# Altium schematic sheet Sheet1.SchDoc
size 454 x 279 mm; SheetNumber: 1; SheetTotal: 1
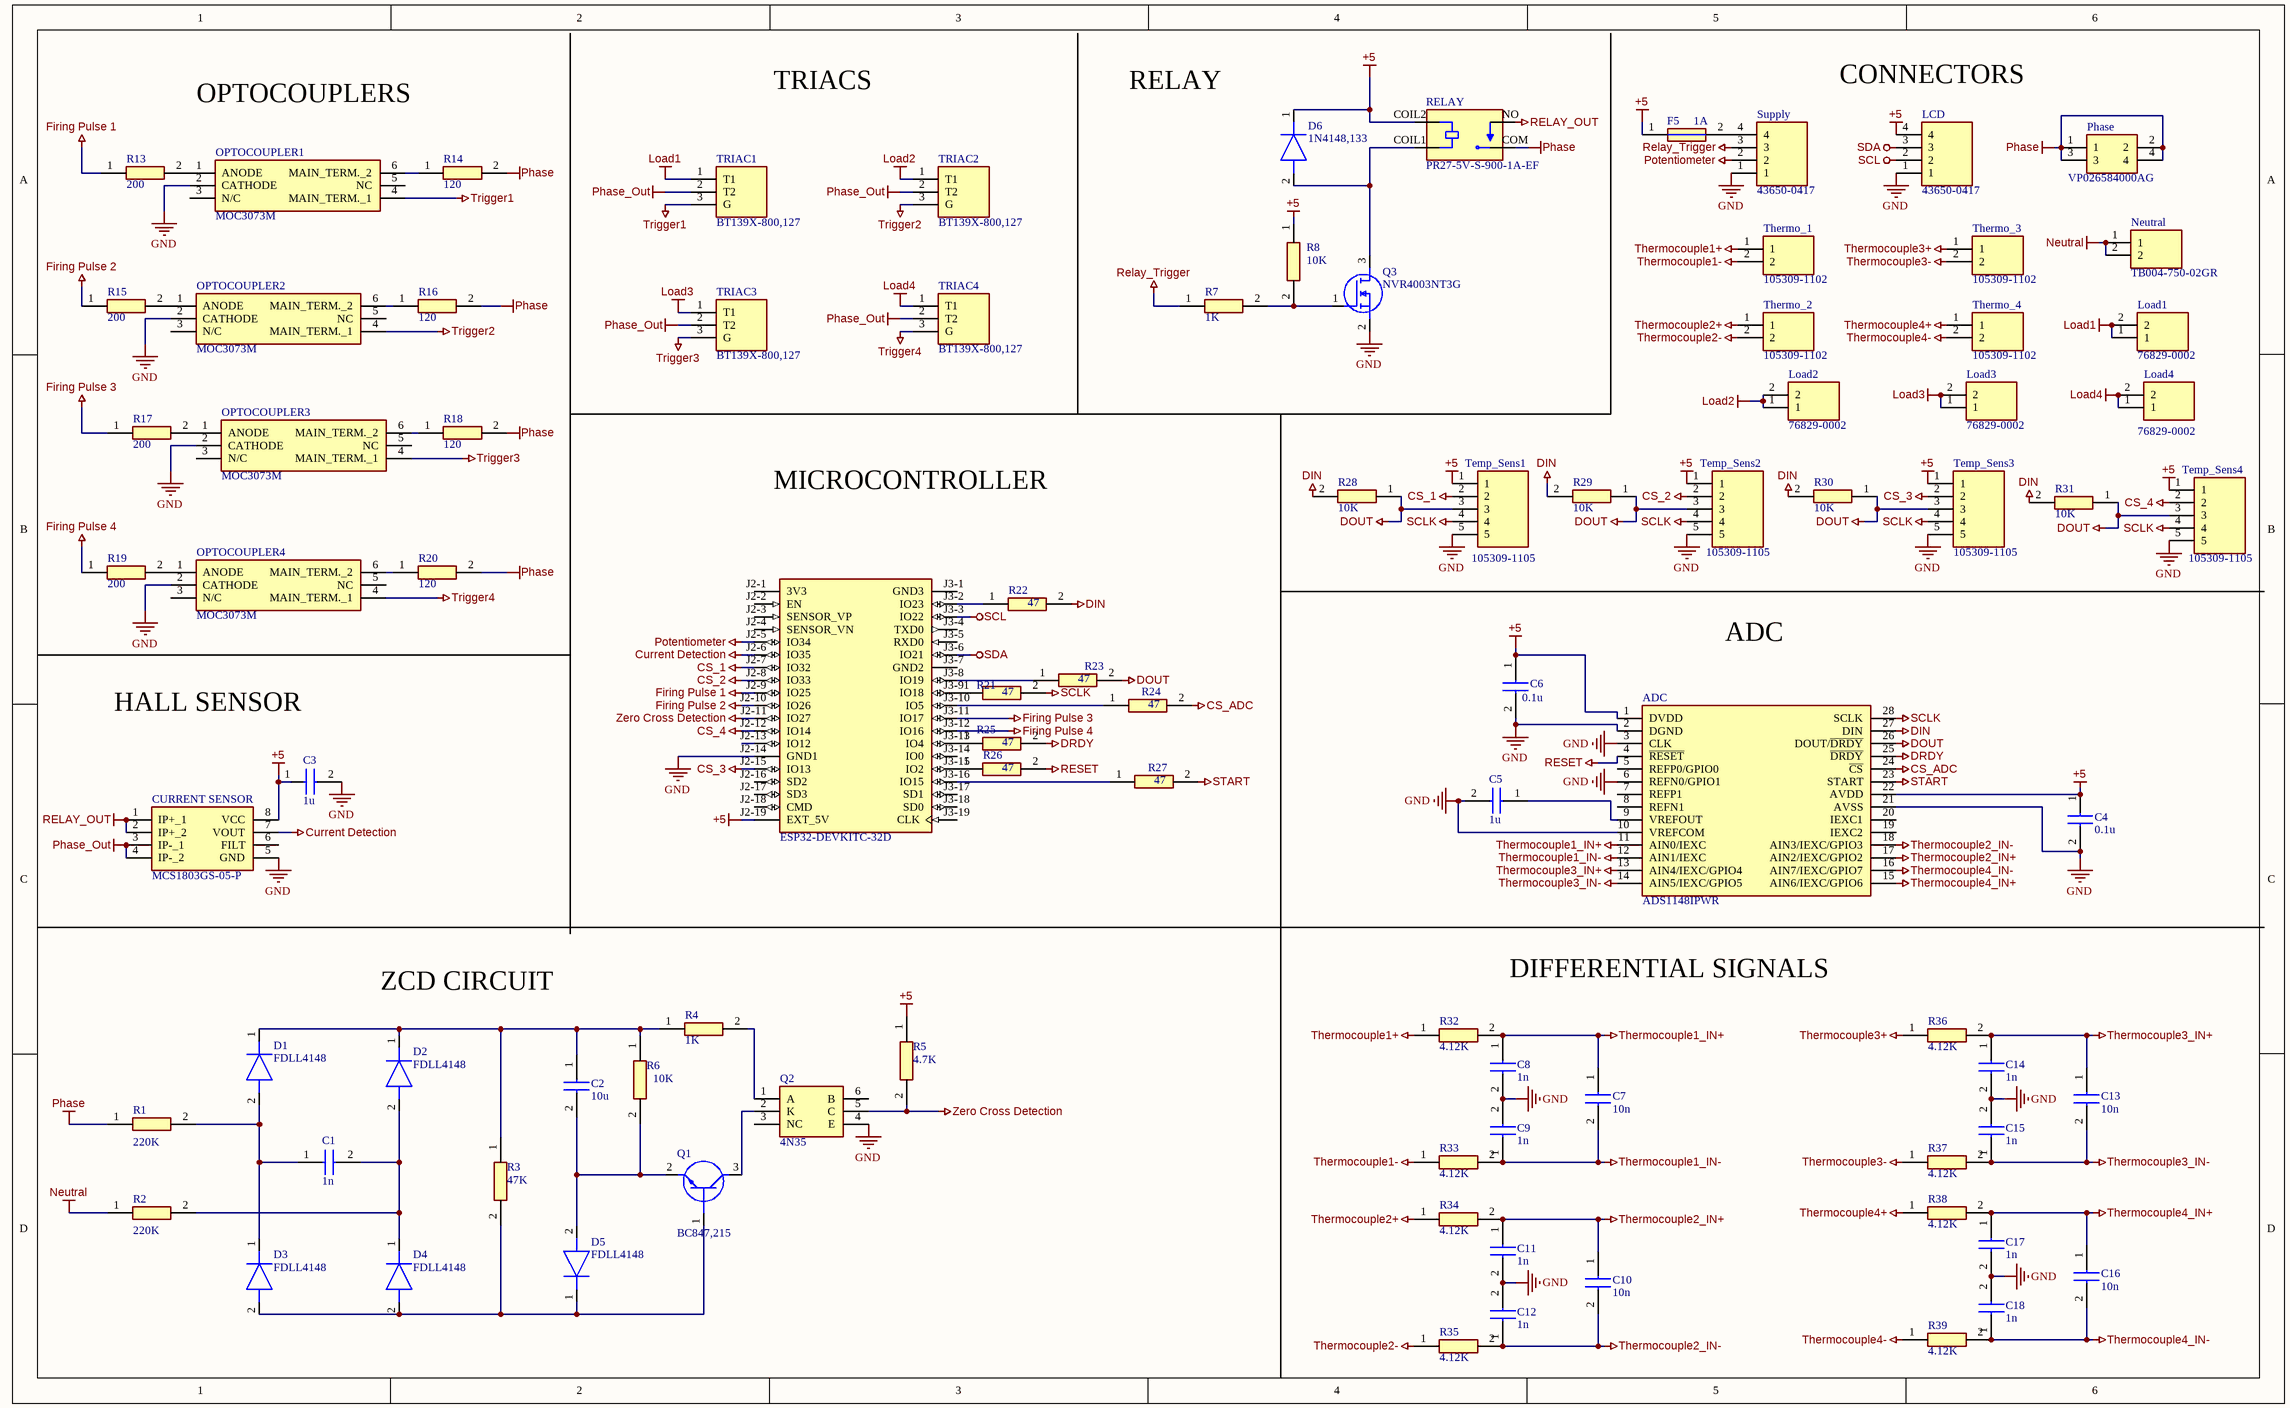
[diagram p0: Sheet1.SchDoc]

## Parts
?  ESP32-DEVKITC-32D  [MODULE_ESP32-DEVKITC-32D]
ADC  ADS1148IPWR  [SOP65P640X120-28N]
C1  1n  [CAPC1608X90N]
C2  10u  [CAPC1608X102N]
C3  1u  [CAPC1608X90N]
C4  0.1u  [CAPC1608X95N]
C5  1u  [CAPC1608X90N]
C6  0.1u  [CAPC1608X95N]
C7  10n  [CAPC1608X87N]
C8  1n  [CAPC1608X90N]
C9  1n  [CAPC1608X90N]
C10  10n  [CAPC1608X87N]
C11  1n  [CAPC1608X90N]
C12  1n  [CAPC1608X90N]
C13  10n  [CAPC1608X87N]
C14  1n  [CAPC1608X90N]
C15  1n  [CAPC1608X90N]
C16  10n  [CAPC1608X87N]
C17  1n  [CAPC1608X90N]
C18  1n  [CAPC1608X90N]
CURRENT_SENSOR  MCS1803GS-05-P  [SOIC127P600X175-8N]
D1  FDLL4148  [FDLL4448]
D2  FDLL4148  [FDLL4448]
D3  FDLL4148  [FDLL4448]
D4  FDLL4148  [FDLL4448]
D5  FDLL4148  [FDLL4448]
D6  1N4148,133  [DIOAD1165W56L425D185]
F5  1A  [FUSC2012X55N]
LCD  43650-0417  [43650-04YY_151617]
Load1  76829-0002  [768290002]
Load2  76829-0002  [768290002]
Load3  76829-0002  [768290002]
Load4  76829-0002  [768290002]
Neutral  TB004-750-02GR  [TB00475002GR]
OPTOCOUPLER1  MOC3073M  [DIP762W51P254L851H508Q6N]
OPTOCOUPLER2  MOC3073M  [DIP762W51P254L851H508Q6N]
OPTOCOUPLER3  MOC3073M  [DIP762W51P254L851H508Q6N]
OPTOCOUPLER4  MOC3073M  [DIP762W51P254L851H508Q6N]
Phase  VP026584000AG  [SHDR4W100P1016_2X2_2032X1830X2850P]
Q1  BC847,215  [BC847215]
Q2  4N35  [DIP762W50P254L712H450Q6N]
Q3  NVR4003NT3G  [SOT96P237X111-3N]
R1  220K  [RESC1608X55N]
R2  220K  [RESC1608X55N]
R3  47K  [RESC1608X55N]
R4  1K  [RESC1608X55N]
R5  4.7K  [RESC1608X55N]
R6  10K  [RESC1608X50N]
R7  1K  [RESC1608X55N]
R8  10K  [RESC1608X50N]
R13  200  [ERA3AEB101V]
R14  120  [RESC1608X50N]
R15  200  [ERA3AEB101V]
R16  120  [RESC1608X50N]
R17  200  [ERA3AEB101V]
R18  120  [RESC1608X50N]
R19  200  [ERA3AEB101V]
R20  120  [RESC1608X50N]
R21  47  [RESC1608X55N]
R22  47  [RESC1608X55N]
R23  47  [RESC1608X55N]
R24  47  [RESC1608X55N]
R25  47  [RESC1608X55N]
R26  47  [RESC1608X55N]
R27  47  [RESC1608X55N]
R28  10K  [RESC1608X50N]
R29  10K  [RESC1608X50N]
R30  10K  [RESC1608X50N]
R31  10K  [RESC1608X50N]
R32  4.12K  [ERJP03_PA3_(0603)]
R33  4.12K  [ERJP03_PA3_(0603)]
R34  4.12K  [ERJP03_PA3_(0603)]
R35  4.12K  [ERJP03_PA3_(0603)]
R36  4.12K  [ERJP03_PA3_(0603)]
R37  4.12K  [ERJP03_PA3_(0603)]
R38  4.12K  [ERJP03_PA3_(0603)]
R39  4.12K  [ERJP03_PA3_(0603)]
RELAY  PR27-5V-S-900-1A-EF  [RELAY_PR27-5V-S-900-1A-EF]
Supply  43650-0417  [43650-04YY_151617]
Temp_Sens1  105309-1105  [1053091105]
Temp_Sens2  105309-1105  [1053091105]
Temp_Sens3  105309-1105  [1053091105]
Temp_Sens4  105309-1105  [1053091105]
Thermo_1  105309-1102  [1053091102]
Thermo_2  105309-1102  [1053091102]
Thermo_3  105309-1102  [1053091102]
Thermo_4  105309-1102  [1053091102]
TRIAC1  BT139X-800,127  [TO254P460X1000X1910-3P]
TRIAC2  BT139X-800,127  [TO254P460X1000X1910-3P]
TRIAC3  BT139X-800,127  [TO254P460X1000X1910-3P]
TRIAC4  BT139X-800,127  [TO254P460X1000X1910-3P]

## Nets
+5: ?.J2-19(EXT_5V) ADC.1(DVDD) ADC.22(AVDD) C3.1 C4.1 C6.1 CURRENT_SENSOR.8(VCC) D6.1(K) F5.1 LCD.4 R5.1 R8.1 RELAY.COIL2 Temp_Sens1.1 Temp_Sens2.1 Temp_Sens3.1 Temp_Sens4.1
CS_1: ?.J2-7(IO32) Temp_Sens1.2
CS_2: ?.J2-8(IO33) Temp_Sens2.2
CS_3: ?.J2-15(IO13) Temp_Sens3.2
CS_4: ?.J2-12(IO14) Temp_Sens4.2
CS_ADC: ADC.24(~{CS}) R24.2
Current Detection: ?.J2-6(IO35) CURRENT_SENSOR.7(VOUT)
DIN: ADC.27(DIN) R22.2 R28.2 R29.2 R30.2 R31.2
DOUT: ADC.26(DOUT/~{DRDY}) R23.2 R28.1 R29.1 R30.1 R31.1 Temp_Sens1.3 Temp_Sens2.3 Temp_Sens3.3 Temp_Sens4.3
DRDY: ADC.25(~{DRDY}) R25.2
Firing Pulse 1: ?.J2-9(IO25) R13.1
Firing Pulse 2: ?.J2-10(IO26) R15.1
Firing Pulse 3: ?.J3-11(IO17) R17.1
Firing Pulse 4: ?.J3-12(IO16) R19.1
GND: ?.J2-14(GND1) ADC.2(DGND) ADC.3(CLK) ADC.6(REFN0/GPIO1) ADC.10(VREFCOM) ADC.21(AVSS) C3.2 C4.2 C5.2 C6.2 C8.2 C9.2 C11.2 C12.2 C14.2 C15.2 C17.2 C18.2 CURRENT_SENSOR.5(GND) LCD.1 OPTOCOUPLER1.2(CATHODE) OPTOCOUPLER2.2(CATHODE) OPTOCOUPLER3.2(CATHODE) OPTOCOUPLER4.2(CATHODE) Q2.4(E) Q3.2(S) Supply.1 Temp_Sens1.5 Temp_Sens2.5 Temp_Sens3.5 Temp_Sens4.5
Load1: Load1.1 Load1.2 TRIAC1.1(T1)
Load2: Load2.1 Load2.2 TRIAC2.1(T1)
Load3: Load3.1 Load3.2 TRIAC3.1(T1)
Load4: Load4.1 Load4.2 TRIAC4.1(T1)
Neutral: Neutral.1 Neutral.2 R2.1
Phase: Phase.1 Phase.2 Phase.3 Phase.4 R1.1 R14.2 R16.2 R18.2 R20.2 RELAY.COM
Phase_Out: CURRENT_SENSOR.3(IP-_1) CURRENT_SENSOR.4(IP-_2) TRIAC1.2(T2) TRIAC2.2(T2) TRIAC3.2(T2) TRIAC4.2(T2)
Potentiometer: ?.J2-5(IO34) Supply.2
RELAY_OUT: CURRENT_SENSOR.1(IP+_1) CURRENT_SENSOR.2(IP+_2) RELAY.NO
Relay_Trigger: R7.1 Supply.3
RESET: ADC.4(~{RESET}) R26.2
SCL: ?.J3-3(IO22) LCD.2
SCLK: ADC.28(SCLK) R21.2 Temp_Sens1.4 Temp_Sens2.4 Temp_Sens3.4 Temp_Sens4.4
SDA: ?.J3-6(IO21) LCD.3
START: ADC.23(START) R27.2
Thermocouple1+: R32.1 Thermo_1.1
Thermocouple1-: R33.1 Thermo_1.2
Thermocouple1_IN+: ADC.11(AIN0/IEXC) C7.1 C8.1 R32.2
Thermocouple1_IN-: ADC.12(AIN1/IEXC) C7.2 C9.1 R33.2
Thermocouple2+: R34.1 Thermo_2.1
Thermocouple2-: R35.1 Thermo_2.2
Thermocouple2_IN+: ADC.17(AIN2/IEXC/GPIO2) C10.1 C11.1 R34.2
Thermocouple2_IN-: ADC.18(AIN3/IEXC/GPIO3) C10.2 C12.1 R35.2
Thermocouple3+: R36.1 Thermo_3.1
Thermocouple3-: R37.1 Thermo_3.2
Thermocouple3_IN+: ADC.13(AIN4/IEXC/GPIO4) C13.1 C14.1 R36.2
Thermocouple3_IN-: ADC.14(AIN5/IEXC/GPIO5) C13.2 C15.1 R37.2
Thermocouple4+: R38.1 Thermo_4.1
Thermocouple4-: R39.1 Thermo_4.2
Thermocouple4_IN+: ADC.15(AIN6/IEXC/GPIO6) C16.1 C17.1 R38.2
Thermocouple4_IN-: ADC.16(AIN7/IEXC/GPIO7) C16.2 C18.1 R39.2
Trigger1: OPTOCOUPLER1.4(MAIN_TERM._1) TRIAC1.3(G)
Trigger2: OPTOCOUPLER2.4(MAIN_TERM._1) TRIAC2.3(G)
Trigger3: OPTOCOUPLER3.4(MAIN_TERM._1) TRIAC3.3(G)
Trigger4: OPTOCOUPLER4.4(MAIN_TERM._1) TRIAC4.3(G)
Zero Cross Detection: ?.J2-11(IO27) Q2.5(C) R5.2
Net?_J3-2: ?.J3-2(IO23) R22.1
Net?_J3-8: ?.J3-8(IO19) R23.1
Net?_J3-9: ?.J3-9(IO18) R21.1
Net?_J3-10: ?.J3-10(IO5) R24.1
Net?_J3-13: ?.J3-13(IO4) R25.1
Net?_J3-15: ?.J3-15(IO2) R26.1
Net?_J3-16: ?.J3-16(IO15) R27.1
NetADC_9: ADC.9(VREFOUT) C5.1
NetC1_1: C1.1 D1.2(A) D3.1(K) R1.2
NetC1_2: C1.2 D2.2(A) D4.1(K) R2.2
NetC2_1: C2.1 D1.1(K) D2.1(K) R3.1 R4.1 R6.1
NetC2_2: C2.2 D5.2(A) Q1.2(E) R6.2
NetD3_2: D3.2(A) D4.2(A) D5.1(K) Q1.1(B) R3.2
NetD6_2: D6.2(A) Q3.3(D) RELAY.COIL1
NetF5_2: F5.2 Supply.4
NetOPTOCOUPLER1_1: OPTOCOUPLER1.1(ANODE) R13.2
NetOPTOCOUPLER1_6: OPTOCOUPLER1.6(MAIN_TERM._2) R14.1
NetOPTOCOUPLER2_1: OPTOCOUPLER2.1(ANODE) R15.2
NetOPTOCOUPLER2_6: OPTOCOUPLER2.6(MAIN_TERM._2) R16.1
NetOPTOCOUPLER3_1: OPTOCOUPLER3.1(ANODE) R17.2
NetOPTOCOUPLER3_6: OPTOCOUPLER3.6(MAIN_TERM._2) R18.1
NetOPTOCOUPLER4_1: OPTOCOUPLER4.1(ANODE) R19.2
NetOPTOCOUPLER4_6: OPTOCOUPLER4.6(MAIN_TERM._2) R20.1
NetQ1_3: Q1.3(C) Q2.2(K)
NetQ2_1: Q2.1(A) R4.2
NetQ3_1: Q3.1(G) R7.2 R8.2

Not connected (* = marked no-connect by the designer): ? J2-1(3V3) J2-2(EN) J2-3(SENSOR_VP) J2-4(SENSOR_VN) J2-13(IO12) J2-16(SD2) J2-17(SD3) J2-18(CMD) J3-1(GND3) J3-4(TXD0) J3-5(RXD0) J3-7(GND2) J3-14(IO0) J3-17(SD1) J3-18(SD0) J3-19(CLK); ADC 5(REFP0/GPIO0) 7(REFP1) 8(REFN1) 19(IEXC2) 20(IEXC1); CURRENT_SENSOR 6(FILT); OPTOCOUPLER1 3(N/C) 5(NC); OPTOCOUPLER2 3(N/C) 5(NC); OPTOCOUPLER3 3(N/C) 5(NC); OPTOCOUPLER4 3(N/C) 5(NC); Q2 3(NC) 6(B)

## Notes on the sheet
- TRIACS
- RELAY
- (near LCD) CONNECTORS
- OPTOCOUPLERS
- MICROCONTROLLER
- ADC
- HALL SENSOR
- DIFFERENTIAL SIGNALS
- ZCD CIRCUIT

## Library data of the parts
? = ESP32-DEVKITC-32D: WiFi Development Tools (802.11) ESP32 General Development Kit, ESP32-WROOM-32D on the board; MF: Espressif Systems; SnapEDA_Link: https://www.snapeda.com/parts/ESP32-DEVKITC-32D/Espressif+Systems/view-part/?ref=snap; Package: None; Value: *; MP: ESP32-DEVKITC-32D; Check_prices: https://www.snapeda.com/parts/ESP32-DEVKITC-32D/Espressif+Systems/view-part/?ref=eda
ADC = ADS1148IPWR: Integrated Circuit; Manufacturer_Name: Texas Instruments; Datasheet Link: https://www.ti.com/lit/ds/symlink/ads1148.pdf?ts=1619426241250&ref_url=https%253A%252F%252Fwww.ti.com%252Fstore%252Fti%252Fen%252Fp%252Fproduct%252F%253Fp%253DADS1148IPWR; Height: 1.2mm; Manufacturer_Part_Number: ADS1148IPWR; Mouser Part Number: 595-ADS1148IPWR; Mouser Price/Stock: https://www.mouser.co.uk/ProductDetail/Texas-Instruments/ADS1148IPWR?qs=J7dbQ%252BTwiys0xPZTIiVXvA%3D%3D; Arrow Part Number: ADS1148IPWR; Arrow Price/Stock: https://www.arrow.com/en/products/ads1148ipwr/texas-instruments
C1 C8 C9 C11 C12 C14 C15 C17 C18 = GRM188R72E102KW07D: Capacitor; Manufacturer_Name: Murata Electronics; Datasheet Link: https://search.murata.co.jp/Ceramy/image/img/A01X/G101/ENG/GRM188R72E102KW07-00B.pdf; Height: 0.9mm; Manufacturer_Part_Number: GRM188R72E102KW07D; Mouser Part Number: 81-GRM18R72E102KW07D; Mouser Price/Stock: https://www.mouser.co.uk/ProductDetail/Murata-Electronics/GRM188R72E102KW07D?qs=0EDxBdtd5TTqBbAL3ZuZjw%3D%3D; Arrow Part Number: GRM188R72E102KW07D; Arrow Price/Stock: https://www.arrow.com/en/products/grm188r72e102kw07d/murata-manufacturing
C2 = 0603YD106KAT2A: Capacitor; Manufacturer_Name: Kyocera AVX; Datasheet Link: https://www.mouser.at/datasheet/2/40/cx5r-776519.pdf; Height: 1.02mm; Manufacturer_Part_Number: 0603YD106KAT2A; Mouser Part Number: 581-0603YD106KAT2A; Mouser Price/Stock: https://www.mouser.co.uk/ProductDetail/KYOCERA-AVX/0603YD106KAT2A?qs=%252BdQmOuGyFcHR%252BKJjw6cgxw%3D%3D
C3 C5 = MSASE168SB7105KTNA01: Capacitor; Manufacturer_Name: TAIYO YUDEN; Datasheet Link: https://ds.yuden.co.jp/TYCOMPAS/or/specSheet?pn=MSASE168SB7105KTNA01; Height: 0.9mm; Manufacturer_Part_Number: MSASE168SB7105KTNA01; Mouser Part Number: 963-MSASE168SB7105KT; Mouser Price/Stock: https://www.mouser.co.uk/ProductDetail/TAIYO-YUDEN/MSASE168SB7105KTNA01?qs=tlsG%2FOw5FFh5ATmmYVDecQ%3D%3D
C4 C6 = C0603C104K5RAC3121: Capacitor; Manufacturer_Name: KEMET; Datasheet Link: https://mouser.componentsearchengine.com/Datasheets/1/C0603C104K5RAC3121.pdf; Height: 0.95mm; Manufacturer_Part_Number: C0603C104K5RAC3121; Mouser Part Number: 80-C603C104K5RAC3121; Mouser Price/Stock: https://www.mouser.co.uk/ProductDetail/KEMET/C0603C104K5RAC3121?qs=oBCMsStVSxe1EkGyoyETtg%3D%3D; Arrow Part Number: C0603C104K5RAC3121; Arrow Price/Stock: https://www.arrow.com/en/products/c0603c104k5rac3121/kemet-corporation?region=nac
C7 C10 C13 C16 = C0603C103K5RAC7013: Capacitor; Manufacturer_Name: KEMET; Datasheet Link: https://www.mouser.es/datasheet/2/212/KEM_C1002_X7R_SMD-1102033.pdf; Height: 0.87mm; Manufacturer_Part_Number: C0603C103K5RAC7013; Mouser Part Number: 80-C0603C103K5RC7013; Mouser Price/Stock: https://www.mouser.co.uk/ProductDetail/KEMET/C0603C103K5RAC7013?qs=rxL5I1UrDR%2FDLdVRYcoJRw%3D%3D; Arrow Part Number: C0603C103K5RAC7013; Arrow Price/Stock: https://www.arrow.com/en/products/c0603c103k5rac7013/kemet-corporation
CURRENT_SENSOR = MCS1803GS-05-P: Integrated Circuit; Manufacturer_Name: Monolithic Power Systems (MPS); Datasheet Link: https://www.monolithicpower.com/en/documentview/productdocument/index/version/2/document_type/Datasheet/lang/en/sku/MCS1803GS/document_id/5067/; Height: 1.75mm; Manufacturer_Part_Number: MCS1803GS-05-P; Mouser Part Number: 946-MCS1803GS-05-P; Mouser Price/Stock: https://www.mouser.co.uk/ProductDetail/Monolithic-Power-Systems-MPS/MCS1803GS-05-P?qs=GedFDFLaBXFKS0RaHM78Vw%3D%3D
D1-D5 = FDLL4148: Diode; Manufacturer_Name: onsemi; Datasheet Link: https://www.onsemi.com/pub/Collateral/1N914-D.PDF; Height: 1mm; Manufacturer_Part_Number: FDLL4148; Mouser Part Number: 512-FDLL4148; Mouser Price/Stock: https://www.mouser.co.uk/ProductDetail/onsemi-Fairchild/FDLL4148?qs=GXJjH%252BIVz3Nb7%252BJnJig0Zw%3D%3D; Arrow Part Number: FDLL4148; Arrow Price/Stock: https://www.arrow.com/en/products/fdll4148/on-semiconductor?utm_currency=USD&region=europe
D6 = 1N4148,133: Diode; Manufacturer_Name: Nexperia; Datasheet Link: https://assets.nexperia.com/documents/data-sheet/1N4148_1N4448.pdf; Manufacturer_Part_Number: 1N4148,133; Mouser Part Number: 771-1N4148,133; Mouser Price/Stock: https://www.mouser.co.uk/ProductDetail/Nexperia/1N4148133?qs=elmhQ6eFu7hy8ApvpFxPZg%3D%3D; Arrow Part Number: 1N4148,133; Arrow Price/Stock: https://www.arrow.com/en/products/1n4148133/nxp-semiconductors
F5 = MFU0805FF00500P100: Fuse; Manufacturer_Name: Vishay; Datasheet Link: https://componentsearchengine.com/Datasheets/2/MFU0805FF00500P100.pdf; Height: 0.55mm; Manufacturer_Part_Number: MFU0805FF00500P100; Mouser Part Number: 594-MFU0805FF00500P1; Mouser Price/Stock: https://www.mouser.co.uk/ProductDetail/Vishay-Beyschlag/MFU0805FF00500P100?qs=oI046glRuru%2F1tLHYz8V8Q%3D%3D; Arrow Part Number: MFU0805FF00500P100; Arrow Price/Stock: https://www.arrow.com/en/products/mfu0805ff00500p100/vishay?region=nac
LCD Supply = 43650-0417: Connector; Manufacturer_Name: Molex; Datasheet Link: https://www.molex.com/pdm_docs/sd/436500215_sd.pdf; Height: 9.9mm; Manufacturer_Part_Number: 43650-0417; Mouser Part Number: 538-43650-0417; Mouser Price/Stock: https://www.mouser.co.uk/ProductDetail/Molex/43650-0417?qs=HSGlLeu24BPtyyP0ZyQMkg%3D%3D
Load1-Load4 = 76829-0002: Connector; Manufacturer_Name: Molex; Datasheet Link: https://www.molex.com/pdm_docs/sd/768290002_sd.pdf; Height: 14.8mm; Manufacturer_Part_Number: 76829-0002; Mouser Part Number: 538-76829-0002; Mouser Price/Stock: https://www.mouser.co.uk/ProductDetail/Molex/76829-0002?qs=KpdAywxU013zSYApMD1zRg%3D%3D
Neutral = TB004-750-02GR: Connector; Manufacturer_Name: Same Sky; Datasheet Link: https://www.sameskydevices.com/product/resource/tb004-750.pdf?srsltid=AfmBOoqxp3TGb86M5ULA4E0wzZ60u_8h9TMDVLcLcvBMs9Tl5jQU3eIt; Height: 14.5mm; Manufacturer_Part_Number: TB004-750-02GR; Mouser Part Number: 179-TB004-750-02GR; Mouser Price/Stock: https://www.mouser.co.uk/ProductDetail/Same-Sky/TB004-750-02GR?qs=%252BXxaIXUDbq2vyEQ2cptGkg%3D%3D
OPTOCOUPLER1-OPTOCOUPLER4 = MOC3073M: Phototransistor; Manufacturer_Name: onsemi; Datasheet Link: https://www.onsemi.com/pub/Collateral/MOC3072M-D.PDF; Height: 5.08mm; Manufacturer_Part_Number: MOC3073M; Mouser Part Number: 863-MOC3073M; Mouser Price/Stock: https://www.mouser.co.uk/ProductDetail/onsemi/MOC3073M?qs=y6ZabgHbY%252Byfe0V2Rxk3CA%3D%3D; Arrow Part Number: MOC3073M; Arrow Price/Stock: https://www.arrow.com/en/products/moc3073m/on-semiconductor
Phase = VP026584000AG: Connector; Manufacturer_Name: Amphenol; Datasheet Link: http://www.anytek.com.tw/UserUpFiles/20181025/d41_CP3hmn_a.pdf; Height: 28.5mm; Manufacturer_Part_Number: VP026584000AG; Mouser Part Number: 523-VP026584000AG; Mouser Price/Stock: https://www.mouser.co.uk/ProductDetail/Amphenol-Anytek/VP026584000AG?qs=T3oQrply3y8ZXElTBVt2Rg%3D%3D
Q1 = BC847,215: Transistor BJT NPN; Manufacturer_Name: Nexperia; Datasheet Link: https://assets.nexperia.com/documents/data-sheet/BC847_SER.pdf; Height: 1.1mm; Manufacturer_Part_Number: BC847,215; Mouser Part Number: 771-BC847215; Mouser Price/Stock: https://www.mouser.co.uk/ProductDetail/Nexperia/BC847215?qs=me8TqzrmIYWROhdFmDauyQ%3D%3D; Arrow Part Number: BC847,215; Arrow Price/Stock: https://www.arrow.com/en/products/bc847215/nexperia?region=europe
Q2 = 4N35: Transistor; Manufacturer_Name: Isocom; Datasheet Link: http://uk.rs-online.com/web/p/products/597302; Height: 4.5mm; Manufacturer_Part_Number: 4N35; Arrow Part Number: 4N35; Arrow Price/Stock: https://www.arrow.com/en/products/4n35/isocom?region=nac
Q3 = NVR4003NT3G: MOSFET (N-Channel); Manufacturer_Name: onsemi; Datasheet Link: https://www.onsemi.com/pub/Collateral/NTR4003N-D.PDF; Height: 1.11mm; Manufacturer_Part_Number: NVR4003NT3G; Mouser Part Number: 863-NVR4003NT3G; Mouser Price/Stock: https://www.mouser.co.uk/ProductDetail/onsemi/NVR4003NT3G?qs=3PKVEWFFm28eDxDv809Sag%3D%3D; Arrow Part Number: NVR4003NT3G; Arrow Price/Stock: https://www.arrow.com/en/products/nvr4003nt3g/on-semiconductor?region=nac
R1 R2 = MCT06030C2203FP500: Resistor; Manufacturer_Name: Vishay; Datasheet Link: http://www.vishay.com/docs/28705/mcx0x0xpro.pdf; Height: 0.55mm; Manufacturer_Part_Number: MCT06030C2203FP500; Mouser Part Number: 594-MCT06030C2203FP5; Mouser Price/Stock: https://www.mouser.co.uk/ProductDetail/Vishay-Beyschlag/MCT06030C2203FP500?qs=sIxod1zg5hFqr3QuK7fi7g%3D%3D; Arrow Part Number: MCT06030C2203FP500; Arrow Price/Stock: https://www.arrow.com/en/products/mct06030c2203fp500/vishay?region=nac
R3 = KTR03EZPF4702: Resistor; Manufacturer_Name: ROHM Semiconductor; Datasheet Link: http://rohmfs.rohm.com/en/products/databook/datasheet/passive/resistor/chip_resistor/ktr.pdf; Height: 0.55mm; Manufacturer_Part_Number: KTR03EZPF4702; Mouser Part Number: 755-KTR03EZPF4702; Mouser Price/Stock: https://www.mouser.com/Search/Refine.aspx?Keyword=755-KTR03EZPF4702
R4 R7 = CR0603-JW-102ELF: Resistor; Manufacturer_Name: Bourns; Datasheet Link: https://www.bourns.com/pdfs/chpreztr.pdf; Height: 0.55mm; Manufacturer_Part_Number: CR0603-JW-102ELF; Mouser Part Number: 652-CR0603-JW-102ELF; Mouser Price/Stock: https://www.mouser.co.uk/ProductDetail/Bourns/CR0603-JW-102ELF?qs=rcPhh2wube3o3zlmFZCUPg%3D%3D; Arrow Part Number: CR0603-JW-102ELF; Arrow Price/Stock: https://www.arrow.com/en/products/cr0603-jw-102elf/bourns?region=nac
R5 = ESR03EZPF4701: Resistor; Manufacturer_Name: ROHM Semiconductor; Datasheet Link: http://uk.rs-online.com/web/p/products/1674382; Height: 0.55mm; Manufacturer_Part_Number: ESR03EZPF4701; Mouser Part Number: 755-ESR03EZPF4701; Mouser Price/Stock: https://www.mouser.co.uk/ProductDetail/ROHM-Semiconductor/ESR03EZPF4701?qs=493kPxzlxfL2NnaeJoZB2Q%3D%3D
R6 R8 R28-R31 = CRCW060310K0FKEA: Resistor; Manufacturer_Name: Vishay; Datasheet Link: http://www.vishay.com/docs/20035/dcrcwe3.pdf; Height: 0.5mm; Manufacturer_Part_Number: CRCW060310K0FKEA; Mouser Part Number: 71-CRCW0603-10K-E3; Mouser Price/Stock: https://www.mouser.co.uk/ProductDetail/Vishay-Dale/CRCW060310K0FKEA?qs=pAO1Z172M84BVnhDjtnsoQ%3D%3D; Arrow Part Number: CRCW060310K0FKEA; Arrow Price/Stock: https://www.arrow.com/en/products/crcw060310k0fkea/vishay?region=nac
R13 R15 R17 R19 = ERA-3AEB201V: Resistor; Manufacturer_Name: Panasonic; Datasheet Link: https://industrial.panasonic.com/cdbs/www-data/pdf/RDM0000/AOA0000C307.pdf; Height: 0.55mm; Manufacturer_Part_Number: ERA-3AEB201V; Mouser Part Number: 667-ERA-3AEB201V; Mouser Price/Stock: https://www.mouser.co.uk/ProductDetail/Panasonic/ERA-3AEB201V?qs=XhO1W%252B5LdJ8wKRfVTWbMaA%3D%3D; Arrow Part Number: ERA-3AEB201V; Arrow Price/Stock: https://www.arrow.com/en/products/era-3aeb201v/panasonic
R14 R16 R18 R20 = CRCW0603120RJNEB: Resistor; Manufacturer_Name: Vishay; Datasheet Link: http://www.vishay.com/docs/20035/dcrcwe3.pdf; Height: 0.5mm; Manufacturer_Part_Number: CRCW0603120RJNEB; Mouser Part Number: 71-CRCW0603120RJNEB; Mouser Price/Stock: https://www.mouser.co.uk/ProductDetail/Vishay-Dale/CRCW0603120RJNEB?qs=dDPdN3Fizmtr%252Bd8kOFNKdA%3D%3D; Arrow Part Number: CRCW0603120RJNEB; Arrow Price/Stock: https://www.arrow.com/en/products/crcw0603120rjneb/vishay?region=nac
R21-R27 = MCT06030C4709FP500: Resistor; Manufacturer_Name: Vishay; Datasheet Link: http://www.vishay.com/docs/28705/mcx0x0xpro.pdf; Height: 0.55mm; Manufacturer_Part_Number: MCT06030C4709FP500; Mouser Part Number: 594-MCT06030C4709FP5; Mouser Price/Stock: https://www.mouser.co.uk/ProductDetail/Vishay-Beyschlag/MCT06030C4709FP500?qs=Vqeyrh6s%2FtGOVFMn1BdPQw%3D%3D
R32-R39 = ERJ-PA3F4121V: Resistor; Manufacturer_Name: Panasonic; Datasheet Link: https://industrial.panasonic.com/cdbs/www-data/pdf/RDO0000/AOA0000C331.pdf; Height: 0.55mm; Manufacturer_Part_Number: ERJ-PA3F4121V; Mouser Part Number: 667-ERJ-PA3F4121V; Mouser Price/Stock: https://www.mouser.com/Search/Refine.aspx?Keyword=667-ERJ-PA3F4121V
Temp_Sens1-Temp_Sens4 = 105309-1105: Connector; Manufacturer_Name: Molex; Datasheet Link: https://componentsearchengine.com/Datasheets/1/105309-1105.pdf; Height: 10.71mm; Manufacturer_Part_Number: 105309-1105; Mouser Part Number: 538-105309-1105; Mouser Price/Stock: https://www.mouser.co.uk/ProductDetail/Molex/105309-1105?qs=5aG0NVq1C4xeVnIB0kAHNg%3D%3D
Thermo_1-Thermo_4 = 105309-1102: Connector; Manufacturer_Name: Molex; Datasheet Link: http://www.molex.com/pdm_docs/sd/1053091102_sd.pdf; Height: 10.51mm; Manufacturer_Part_Number: 105309-1102; Mouser Part Number: 538-105309-1102; Mouser Price/Stock: https://www.mouser.co.uk/ProductDetail/Molex/105309-1102?qs=5aG0NVq1C4zzTOxEjLJqtg%3D%3D
TRIAC1-TRIAC4 = BT139X-800,127: Thermistor; Manufacturer_Name: WeEn Semiconductors; Datasheet Link: https://www.mouser.co.uk/datasheet/2/848/BT139X-800-1104332.pdf; Height: 4.6mm; Manufacturer_Part_Number: BT139X-800,127; Mouser Part Number: 771-BT139X-800127; Mouser Price/Stock: https://www.mouser.co.uk/ProductDetail/WeEn-Semiconductors/BT139X-800127?qs=me8TqzrmIYUpGZ3R%252BN0ixA%3D%3D; Arrow Part Number: BT139X-800,127; Arrow Price/Stock: https://www.arrow.com/en/products/bt139x-800127/ween-semiconductors?utm_currency=USD&region=europe
RELAY = PR27-5V-S-900-1A-EF: Package: None; Price: None; Value: *; MP: PR27-5V-S-900-1A-EF; Availability: Unavailable